# Altium schematic sheet LT3042_12V_5V_LNLDO.SchDoc
size A4
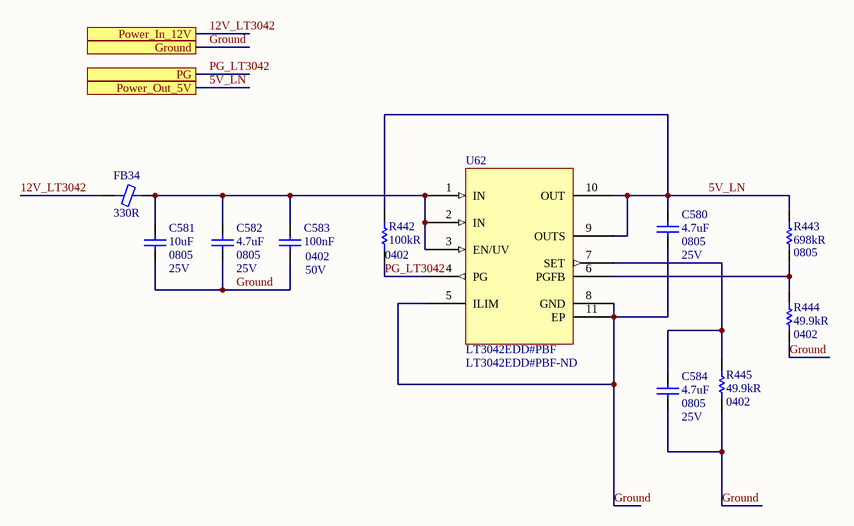
[diagram p0: LT3042_12V_5V_LNLDO.SchDoc]

## Parts
C580  4.7uF  Case/Package: 0805  Voltage Rating: 25V  [CAP 0805/2012 RF]
C581  10uF  Case/Package: 0805  Voltage Rating: 25V  [CAP 0805/2012 RF]
C582  4.7uF  Case/Package: 0805  Voltage Rating: 25V  [CAP 0805/2012 RF]
C583  100nF  Case Code (Imperial): 0402  Voltage: 50V  [CAP 0402/1005 KK]
C584  4.7uF  Case/Package: 0805  Voltage Rating: 25V  [CAP 0805/2012 RF]
FB34  330R  [FER 0603/1608]
R442  100kR  Case/Package: 0402  [RES 0402/1005 RF KK]
R443  698kR  Case/Package: 0805  [RES 0805/2012 RF]
R444  49.9kR  Case/Package: 0402  [RES 0402/1005 RF KK]
R445  49.9kR  Case/Package: 0402  [RES 0402/1005 RF KK]
U62  LT3042EDD#PBF  Supplier Part Number 1: LT3042EDD#PBF-ND  [LT3042]

## Ports
Ground, PG, Power_In_12V, Power_Out_5V

## Nets
5V_LN: C580.2 R442.2 R443.2 U62.9(OUTS) U62.10(OUT) ; port Power_Out_5V
12V_LT3042: FB34.1 ; port Power_In_12V
Ground: C580.1 C581.1 C582.1 C583.1 C584.1 R444.1 R445.1 U62.5(ILIM) U62.8(GND) U62.11(EP) ; port Ground
PG_LT3042: R442.1 U62.4(PG) ; port PG
NetC581_2: C581.2 C582.2 C583.2 FB34.2 U62.1(IN) U62.2(IN) U62.3(EN/UV)
NetC584_2: C584.2 R445.2 U62.7(SET)
NetR443_1: R443.1 R444.2 U62.6(PGFB)

## Notes on the sheet
- Title
- Size:
- Date:
- A3
- Number:
- Time:
- Revision:
- Sheet
- of
- File:

## Library data of the parts
C580 C582 C584 = Capacitor: CAP CER 4.7UF 25V X5R 0805; Manufacturer: Murata; Manufacturer Part Number: GRM219R61E475KA73D; Material: Ceramic; Tolerance: 10%; Supplier 1: Digi-Key; Supplier Part Number 1: 490-12753-1-ND; RoHS: Yes; Category: Ceramic Capacitors; Stock 1: 21355; Pricing 1: 1=0,30000, 10=0,20500, 100=0,11610, 500=0,08198, 1000=0,07173 (USD); Mount: Surface Mount; Weight: 0.000335oz; Case Code (Metric): 2012; Case Code (Imperial): 0805; Min Operating Temperature: -55°C; Max Operating Temperature: 85°C; Dielectric: X5R; Capacitance: 4.7uF; Packaging: Tape and Reel; Termination: SMD/SMT; Composition: Ceramic; Voltage Rating (DC): 25V; Package Quantity: 4000; Length: 2mm; Height: 0.85mm; Width: 1.25mm; Thickness: 0.037inch; ComponentLink1URL: http://www.mouser.com/ds/2/281/c02e-2905.pdf?src-supplier=Mouser; ComponentLink1Description: http://www.mouser.com/ds/2/281/c02e-2905.pdf?src-supplier=Mouser; ComponentLink2URL: http://search.murata.co.jp/Ceramy/image/img/A01X/partnumbering_e_01.pdf?src-supplier=Digi-Key; ComponentLink2Description: http://search.murata.co.jp/Ceramy/image/img/A01X/partnumbering_e_01.pdf?src-supplier=Digi-Key; ComponentLink3URL: http://search.murata.co.jp/Ceramy/image/img/A01X/G101/ENG/GRM219R61E475KA73-01.pdf?src-supplier=Digi-Key; ComponentLink3Description: http://search.murata.co.jp/Ceramy/image/img/A01X/G101/ENG/GRM219R61E475KA73-01.pdf?src-supplier=Digi-Key
C581 = Capacitor: CAP CER 10UF 25V X5R 0805; Manufacturer: KEMET; Manufacturer Part Number: C0805C106K3PACTU; Dielectric Material: Ceramic; Dissipation Factor: 10%; Supplier 1: Digi-Key; Supplier Part Number 1: 399-11939-6-ND; RoHS: Yes; Category: Ceramic Capacitors; Stock 1: 4800; Pricing 1: 1=0,24000, 10=0,16800, 100=0,09510, 500=0,06710, 1000=0,05872 (USD); Mount: Surface Mount; Case Code (Metric): 2012; Case Code (Imperial): 0805; Min Operating Temperature: -55°C; Max Operating Temperature: 85°C; Dielectric: X5R; Packaging: Cut Tape; Voltage: 25V; Termination: Solder; Tolerance: 10%; Voltage Rating (DC): 25V; Capacitance: 10uF; Length: 0.079inch; Height: 1.25mm; Depth: 1.25mm; Width: 0.049inch; Thickness: 0.057inch; REACH SVHC: No SVHC; Lead Free: Lead Free; ComponentLink1URL: http://www.farnell.com/datasheets/2741185.pdf?src-supplier=Farnell; ComponentLink1Description: http://www.farnell.com/datasheets/2741185.pdf?src-supplier=Farnell; ComponentLink2URL: http://www.farnell.com/datasheets/2112054.pdf?src-supplier=Farnell; ComponentLink2Description: http://www.farnell.com/datasheets/2112054.pdf?src-supplier=Farnell; ComponentLink3URL: http://www.alliedelec.com/m/d/f3c02ddb98afa3dd1adcb801109671e9.pdf?src-supplier=Allied+Electronics; ComponentLink3Description: http://www.alliedelec.com/m/d/f3c02ddb98afa3dd1adcb801109671e9.pdf?src-supplier=Allied+Electronics; ComponentLink4URL: http://www.farnell.com/datasheets/2112054.pdf?src-supplier=Element14; ComponentLink4Description: http://www.farnell.com/datasheets/2112054.pdf?src-supplier=Element14; ComponentLink5URL: https://api.kemet.com/component-edge/download/datasheet/C0805C106K3PAC7800.pdf?src-supplier=Digi-Key; ComponentLink5Description: https://api.kemet.com/component-edge/download/datasheet/C0805C106K3PAC7800.pdf?src-supplier=Digi-Key; ComponentLink6URL: http://www.kemet.com/docfinder?Partnumber=C0805C106K3PAC7800&src-supplier=Digi-Key; ComponentLink6Description: http://www.kemet.com/docfinder?Partnumber=C0805C106K3PAC7800&src-supplier=Digi-Key; ComponentLink7URL: http://www.kemet.com/Lists/ProductCatalog/Attachments/19/KEM_C1006_X5R_SMD.pdf?src-supplier=Avnet; ComponentLink7Description: http://www.kemet.com/Lists/ProductCatalog/Attachments/19/KEM_C1006_X5R_SMD.pdf?src-supplier=Avnet
C583 = Capacitor: CAP CER 0.1UF 50V X5R 0402; Manufacturer: Murata; Manufacturer Part Number: GRM155R61H104KE14D; Dielectric Material: Ceramic; Dissipation Factor: 0.025%; Tolerance: 10%; Supplier 1: Digi-Key; Supplier Part Number 1: 490-10697-1-ND; RoHS: Yes; Category: Ceramic Capacitors; Stock 1: 435607; Pricing 1: 1=0,10000, 10=0,04600, 100=0,02050, 500=0,01464, 1000=0,01150, 2500=0,01045, 5000=0,00961 (USD); Mount: Surface Mount; Case/Package: 0402; Weight: 0.000212oz; Case Code (Metric): 1005; Min Operating Temperature: -55°C; Max Operating Temperature: 85°C; Capacitance: 100nF; Packaging: Tape and Reel; Voltage Rating: 50V; Dielectric: X5R; Termination: SMD/SMT; Composition: Ceramic; Voltage Rating (DC): 50V; Package Quantity: 10000; Length: 1mm; Height: 0.5mm; Width: 0.02inch; Thickness: 0.022inch; Depth: 0.5mm; REACH SVHC: No SVHC; Lead Free: Lead Free; ComponentLink1URL: http://www.farnell.com/datasheets/2079150.pdf?src-supplier=Farnell; ComponentLink1Description: http://www.farnell.com/datasheets/2079150.pdf?src-supplier=Farnell; ComponentLink2URL: http://www.mouser.com/ds/2/281/c02e-2905.pdf?src-supplier=Mouser; ComponentLink2Description: http://www.mouser.com/ds/2/281/c02e-2905.pdf?src-supplier=Mouser; ComponentLink3URL: http://www.farnell.com/datasheets/2079150.pdf?src-supplier=Element14; ComponentLink3Description: http://www.farnell.com/datasheets/2079150.pdf?src-supplier=Element14; ComponentLink4URL: http://search.murata.co.jp/Ceramy/image/img/A01X/G101/ENG/GRM155R61H104KE14-01.pdf?src-supplier=Digi-Key; ComponentLink4Description: http://search.murata.co.jp/Ceramy/image/img/A01X/G101/ENG/GRM155R61H104KE14-01.pdf?src-supplier=Digi-Key
FB34 = Ferrite: Ferrite Beads Power Chip 330Ohm 25% 100MHz 800mA 210mOhm DCR 0603 Automotive T/R; Manufacturer: Taiyo Yuden; Manufacturer Part Number: FBMH1608HL331-T; Shielding: Unshielded; Number of Lines: 1; DC Resistance (DCR): 210mR; Max DC Current: 600mA; Supplier 1: Digi-Key; Supplier Part Number 1: 587-1734-1-ND; RoHS: Yes; Category: Ferrite Beads and Chips; Stock 1: 4788; Pricing 1: 1=0,11000, 10=0,09400, 25=0,07320, 50=0,06060, 100=0,05230, 250=0,04180, 500=0,03762, 1000=0,03135 (USD); Mount: Surface Mount; Case/Package: 0603; Number of Pins: 2; Core Material: Ferrite; Case Code (Metric): 1608; Case Code (Imperial): 0603; Material: Ferrite; Min Operating Temperature: -40°C; Max Operating Temperature: 125°C; Packaging: Tape and Reel; Frequency: 100MHz; Package Quantity: 1; Impedance: 330R; Tolerance: 25%; Max Current Rating: 800mA; Termination: SMD/SMT; Test Frequency: 100MHz; Composition: Ferrite Bead; Length: 1.6mm; Height: 0.8mm; Width: 0.031inch; Depth: 0.95mm; Lead Free: Lead Free; Halogen Free: Halogen Free; ComponentLink1URL: https://datasheet.ciiva.com/1012/fbmh1608hl331-t-ss-1012496.pdf?src-supplier=Digi-Key; ComponentLink1Description: https://datasheet.ciiva.com/1012/fbmh1608hl331-t-ss-1012496.pdf?src-supplier=Digi-Key; ComponentLink2URL: https://datasheet.ciiva.com/25614/0900766b810b37be-25614404.pdf?src-supplier=RSComponents; ComponentLink2Description: https://datasheet.ciiva.com/25614/0900766b810b37be-25614404.pdf?src-supplier=RSComponents; ComponentLink3URL: https://datasheet.ciiva.com/1012/chipbeads01-e-1012495.pdf?src-supplier=Digi-Key; ComponentLink3Description: https://datasheet.ciiva.com/1012/chipbeads01-e-1012495.pdf?src-supplier=Digi-Key; ComponentLink4URL: https://datasheet.ciiva.com/1012/chipbeads01-e-1012494.pdf?src-supplier=Digi-Key; ComponentLink4Description: https://datasheet.ciiva.com/1012/chipbeads01-e-1012494.pdf?src-supplier=Digi-Key
R442 = Resistor: Manufacturer 1: Panasonic; Manufacturer Part Number 1: ERA-2AED104X; Tolerance: 0.5%; Power Rating: 63mW; Voltage Rating: 25V; Temperature Coefficient: 25ppm/°C; Supplier 1: Digi-Key; Supplier Part Number 1: P100KDECT-ND; Stock 1: 54338; Pricing 1: 1=0.22000, 10=0.18800, 100=0.07350, 1000=0.03077, 2500=0.02820, 5000=0.02564 (USD); RoHS: Yes; Mount: Surface Mount; Case Code (Imperial): 0402; Case Code (Metric): 1005; Contact Plating: Tin; Min Operating Temperature: -55°C; Max Operating Temperature: 155°C; Resistance: 100kR; Packaging: Tape and Reel; Package Quantity: 10000; Composition: Metal Film,Thin Film; Number of Terminations: 2; Military Standard: Not; Termination: SMD/SMT; Max Power Dissipation: 63mW; Voltage Rating (DC): 25V; Length: 1mm; Height: 0.016inch; Width: 0.5mm; Depth: 0.5mm; Radiation Hardening: No; REACH SVHC: No SVHC; Lead Free: Lead Free; ComponentLink1URL: https://datasheet.ciiva.com/24028/aoa0000ce26-197354-24028150.pdf?src-supplier=Mouser; ComponentLink1Description: https://datasheet.ciiva.com/24028/aoa0000ce26-197354-24028150.pdf?src-supplier=Mouser; ComponentLink2URL: https://datasheet.ciiva.com/43470/1776116-43470438.pdf?src-supplier=Farnell; ComponentLink2Description: https://datasheet.ciiva.com/43470/1776116-43470438.pdf?src-supplier=Farnell; ComponentLink3URL: https://datasheet.ciiva.com/7830/1776116-7830920.pdf?src-supplier=Element14; ComponentLink3Description: https://datasheet.ciiva.com/7830/1776116-7830920.pdf?src-supplier=Element14; ComponentLink4URL: https://datasheet.ciiva.com/46378/1776116-46378234.pdf?src-supplier=Element14; ComponentLink4Description: https://datasheet.ciiva.com/46378/1776116-46378234.pdf?src-supplier=Element14; ComponentLink5URL: https://datasheet.ciiva.com/16780/70068849-16780139.pdf?src-supplier=Allied+Electronics; ComponentLink5Description: https://datasheet.ciiva.com/16780/70068849-16780139.pdf?src-supplier=Allied+Electronics; ComponentLink6URL: https://datasheet.ciiva.com/9117/aoa0000ce26-9117229.pdf?src-supplier=Avnet; ComponentLink6Description: https://datasheet.ciiva.com/9117/aoa0000ce26-9117229.pdf?src-supplier=Avnet; ComponentLink7URL: https://datasheet.ciiva.com/16511/aoa0000ce26-16511566.pdf?src-supplier=Avnet+Asia; ComponentLink7Description: https://datasheet.ciiva.com/16511/aoa0000ce26-16511566.pdf?src-supplier=Avnet+Asia; ComponentLink8URL: https://datasheet.ciiva.com/30225/54aoa0000ce26-30225311.pdf?src-supplier=Onlinecomponents.com; ComponentLink8Description: https://datasheet.ciiva.com/30225/54aoa0000ce26-30225311.pdf?src-supplier=Onlinecomponents.com
R443 = Resistor: Panasonic ERA Series Thin Film Surface Mount Fixed Resistor 0805 Case 698k 0.1% 0.125W 25ppm/C; Manufacturer Part Number: ERA-6AEB6983V; Power Rating: 125mW; Voltage Rating: 100V; Temperature Coefficient: 25ppm/°C; Supplier 1: Digi-Key; Supplier Part Number 1: P698KDACT-ND; Manufacturer: Panasonic; RoHS: Yes; Category: Chip SMD Resistors; Stock 1: 9459; Pricing 1: 1=0,36000, 10=0,30200, 100=0,11820, 1000=0,04948, 2500=0,04536 (USD); Mount: Surface Mount; Number of Pins: 2; Weight: 0.000194oz; Case Code (Metric): 2012; Case Code (Imperial): 0805; Contact Plating: Tin; Min Operating Temperature: -55°C; Max Operating Temperature: 155°C; Tolerance: 0.1%; Resistance: 698kR; Packaging: Tape and Reel; Package Quantity: 5000; Composition: Thin Film,Metal Film; Number of Terminations: 2; Termination: SMD/SMT; Max Power Dissipation: 125mW; Voltage Rating (DC): 100V; Features: Automotive AEC-Q200; Length: 2mm; Height: 0.5mm; Width: 1.25mm; Depth: 1.25mm; Radiation Hardening: No; REACH SVHC: No SVHC; Lead Free: Lead Free; ComponentLink1URL: https://datasheet.ciiva.com/11810/0900766b80eb1d8c-11810720.pdf?src-supplier=RSComponents; ComponentLink1Description: https://datasheet.ciiva.com/11810/0900766b80eb1d8c-11810720.pdf?src-supplier=RSComponents; ComponentLink2URL: https://datasheet.ciiva.com/41450/001181413-da-01-en-widerstand-era-0805-698k-0-1-5000st-41450573.pdf?src-supplier=Conrad; ComponentLink2Description: https://datasheet.ciiva.com/41450/001181413-da-01-en-widerstand-era-0805-698k-0-1-5000st-41450573.pdf?src-supplier=Conrad; ComponentLink3URL: https://datasheet.ciiva.com/6138/485442-6138277.pdf?src-supplier=Farnell; ComponentLink3Description: https://datasheet.ciiva.com/6138/485442-6138277.pdf?src-supplier=Farnell; ComponentLink4URL: https://datasheet.ciiva.com/9180/aoa0000ce26-9180341.pdf?src-supplier=Avnet; ComponentLink4Description: https://datasheet.ciiva.com/9180/aoa0000ce26-9180341.pdf?src-supplier=Avnet; ComponentLink5URL: https://datasheet.ciiva.com/17205/aoa0000ce26-17205334.pdf?src-supplier=Avnet+Europe; ComponentLink5Description: https://datasheet.ciiva.com/17205/aoa0000ce26-17205334.pdf?src-supplier=Avnet+Europe; ComponentLink6URL: https://datasheet.ciiva.com/6138/485442-6138279.pdf?src-supplier=Farnell; ComponentLink6Description: https://datasheet.ciiva.com/6138/485442-6138279.pdf?src-supplier=Farnell; ComponentLink7URL: https://datasheet.ciiva.com/7753/485442-7753914.pdf?src-supplier=Element14; ComponentLink7Description: https://datasheet.ciiva.com/7753/485442-7753914.pdf?src-supplier=Element14; ComponentLink8URL: https://datasheet.ciiva.com/7753/485442-7753915.pdf?src-supplier=Element14; ComponentLink8Description: https://datasheet.ciiva.com/7753/485442-7753915.pdf?src-supplier=Element14
R444 R445 = Resistor: Res Thin Film 0402 49.9K Ohm 0.1% 1/16W 25ppm/C Molded SMD SMD Punched Carrier T/R; Manufacturer: Panasonic; Manufacturer Part Number: ERA-2AEB4992X; Power Rating: 62.5mW; Temperature Coefficient: 25ppm/°C; Voltage Rating: 50V; Max Power Dissipation: 63mW; Supplier 1: Digi-Key; Supplier Part Number 1: P49.9KDCCT-ND; RoHS: Yes; Category: Chip SMD Resistors; Stock 1: 70823; Pricing 1: 1=0,43000, 10=0,30500, 100=0,12220, 1000=0,06021, 2500=0,05579, 5000=0,05047 (USD); Mount: Surface Mount; Case Code (Metric): 1005; Case Code (Imperial): 0402; Contact Plating: Tin; Min Operating Temperature: -55°C; Max Operating Temperature: 155°C; Resistance: 49.9kR; Packaging: Tape and Reel; Tolerance: 0.1%; Package Quantity: 1; Composition: Thin Film; Number of Terminations: 2; Voltage Rating (DC): 50V; Features: Automotive AEC-Q200; Military Standard: Not; Length: 1mm; Height: 0.016inch; Width: 0.02inch; Depth: 0.5mm; REACH SVHC: Unknown; Lead Free: Lead Free; ComponentLink1URL: https://datasheet.ciiva.com/9189/aoa0000ce26-9189149.pdf?src-supplier=Avnet; ComponentLink1Description: https://datasheet.ciiva.com/9189/aoa0000ce26-9189149.pdf?src-supplier=Avnet
U62 = LT3042EDD#PBF: LINEAR TECHNOLOGY         LT3042EDD#PBF             LDO Voltage Regulator, Adjustable, 1.8V to 20V in, 350mV drop, 0V to 15V/0.2A out, DFN-10; Manufacturer: Analog Devices / Linear Technology; Output Voltage: 15V; Output Current: 200mA; Number of Regulators: 1; Min Current Limit: 220mA; Min Output Voltage: 0uV; Supplier 1: Digi-Key; Manufacturer Part Number: LT3042EDD#PBF; RoHS: Yes; Category: Voltage Regulators - Linear; Stock 1: 15977; Pricing 1: 1=5,46000, 25=3,62360, 100=2,99600 (USD); Mount: Surface Mount; Case/Package: DFN; Number of Pins: 10; Min Operating Temperature: -40°C; Max Operating Temperature: 125°C; Packaging: Rail/Tube; Dropout Voltage: 350mV; Min Input Voltage: 1.8V; Max Input Voltage: 20V; Max Output Voltage: 15V; Output Type: Adjustable; REACH SVHC: No SVHC; ComponentLink1URL: http://www.farnell.com/datasheets/1941078.pdf?src-supplier=Farnell; ComponentLink1Description: http://www.farnell.com/datasheets/1941078.pdf?src-supplier=Farnell; ComponentLink2URL: http://www.linear.com/docs/55649?src-supplier=Digi-Key; ComponentLink2Description: http://www.linear.com/docs/55649?src-supplier=Digi-Key; ComponentLink3URL: http://www.farnell.com/datasheets/1941078.pdf?src-supplier=Element14; ComponentLink3Description: http://www.farnell.com/datasheets/1941078.pdf?src-supplier=Element14